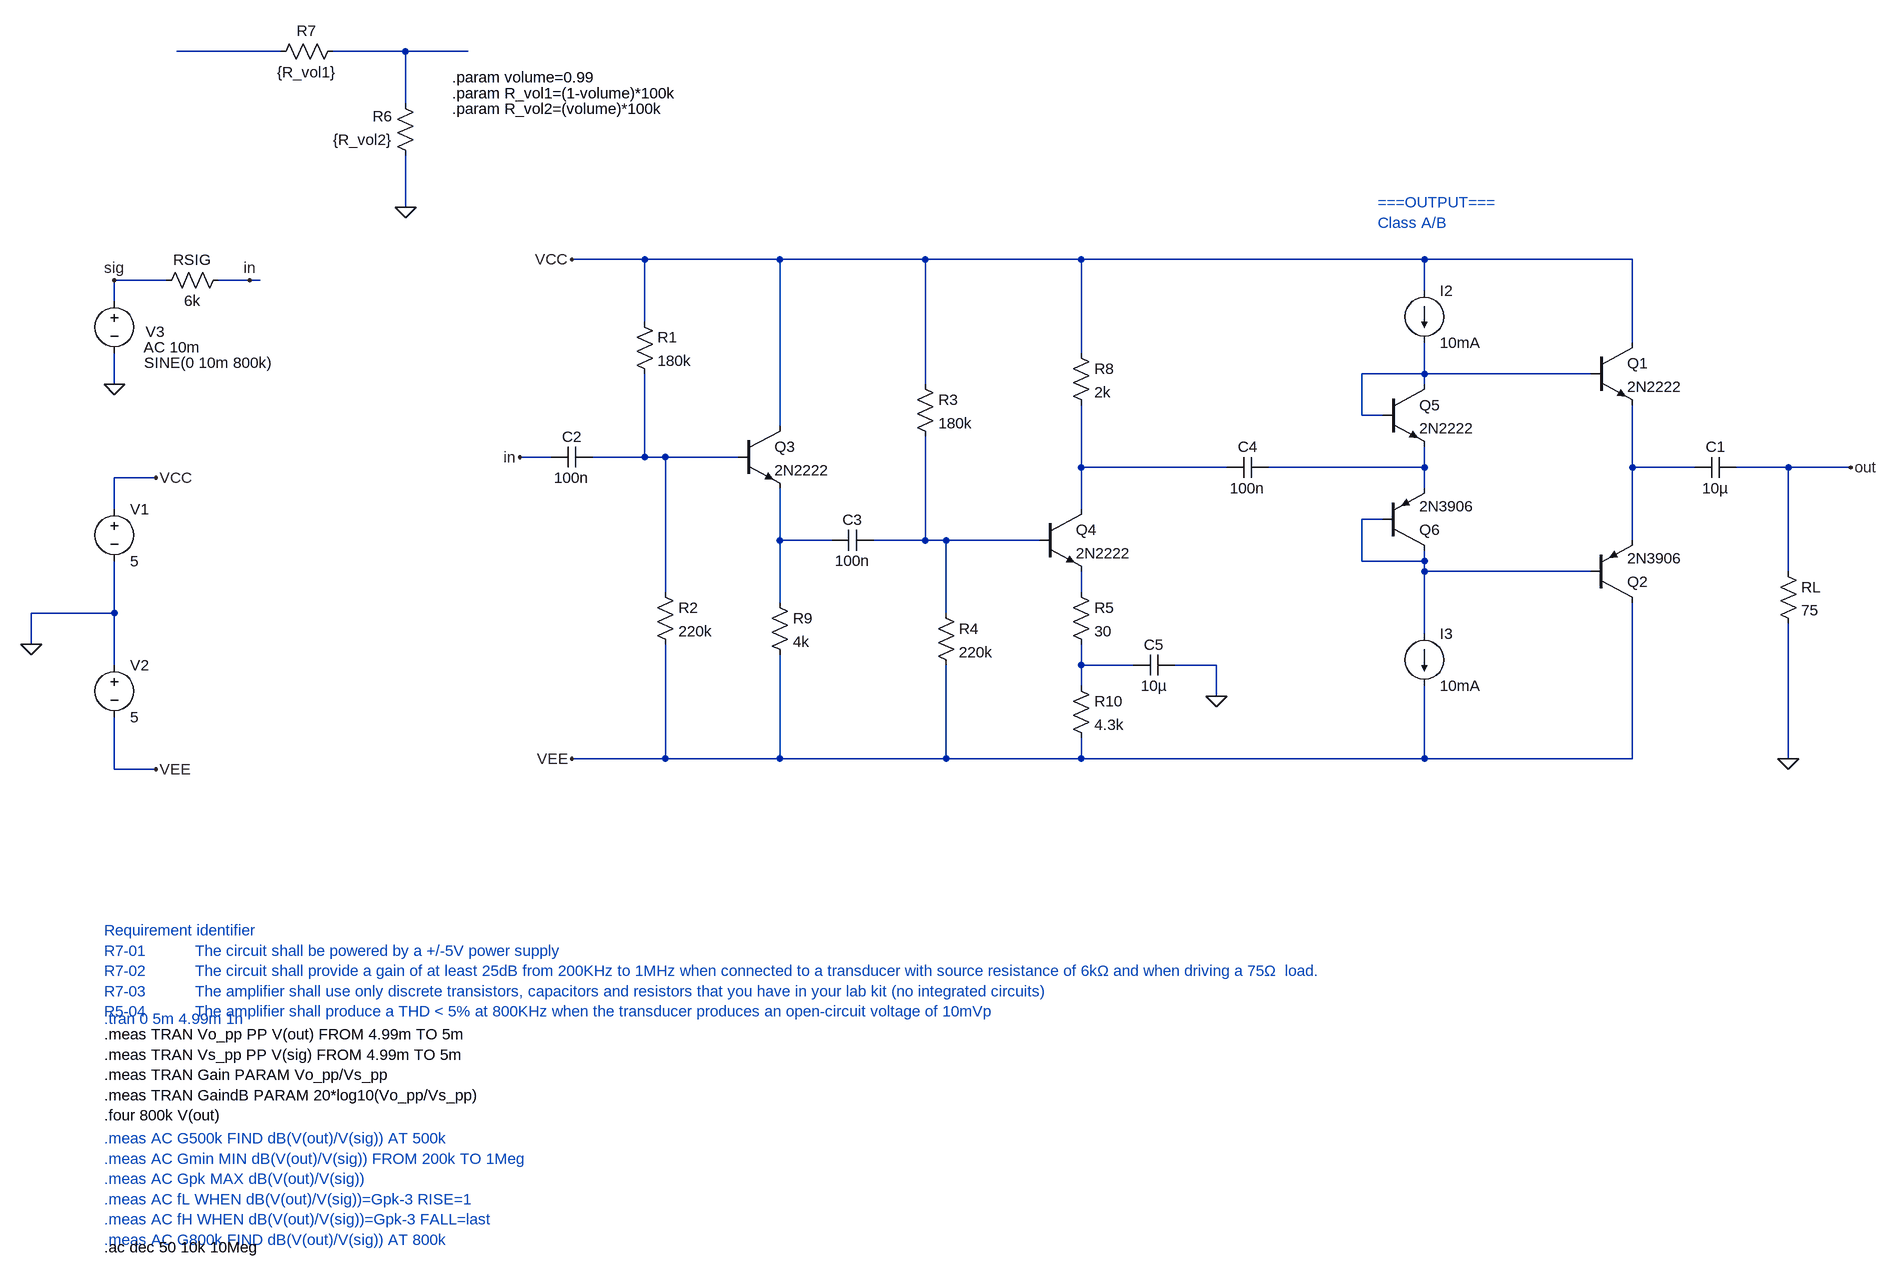
[diagram p0: schematic Lab 7 Amplifer V1.asc]
Lab 7 Amplifer V1.asc, the LTspice schematic file:
Version 4.1
SHEET 1 2900 1024
WIRE 208 -832 48 -832
WIRE 400 -832 288 -832
WIRE 496 -832 400 -832
WIRE 400 -752 400 -832
WIRE 400 -592 400 -672
WIRE 768 -512 656 -512
WIRE 976 -512 768 -512
WIRE 1200 -512 976 -512
WIRE 1440 -512 1200 -512
WIRE 1968 -512 1440 -512
WIRE 2288 -512 1968 -512
WIRE 32 -480 -48 -480
WIRE 160 -480 112 -480
WIRE 176 -480 160 -480
WIRE 1968 -464 1968 -512
WIRE -48 -448 -48 -480
WIRE 768 -416 768 -512
WIRE 2288 -384 2288 -512
WIRE 1440 -368 1440 -512
WIRE 1968 -336 1968 -384
WIRE 1968 -336 1872 -336
WIRE 2224 -336 1968 -336
WIRE -48 -320 -48 -368
WIRE 1200 -320 1200 -512
WIRE 1968 -320 1968 -336
WIRE 1872 -272 1872 -336
WIRE 1904 -272 1872 -272
WIRE 976 -256 976 -512
WIRE 624 -208 576 -208
WIRE 768 -208 768 -336
WIRE 768 -208 688 -208
WIRE 800 -208 768 -208
WIRE 912 -208 800 -208
WIRE 1440 -192 1440 -288
WIRE 1664 -192 1440 -192
WIRE 1968 -192 1968 -224
WIRE 1968 -192 1728 -192
WIRE 2288 -192 2288 -288
WIRE 2384 -192 2288 -192
WIRE 2528 -192 2448 -192
WIRE 2624 -192 2528 -192
WIRE 16 -176 -48 -176
WIRE 1968 -160 1968 -192
WIRE -48 -128 -48 -176
WIRE 1440 -128 1440 -192
WIRE 1904 -112 1872 -112
WIRE 976 -80 976 -160
WIRE 1056 -80 976 -80
WIRE 1200 -80 1200 -240
WIRE 1200 -80 1120 -80
WIRE 1232 -80 1200 -80
WIRE 1376 -80 1232 -80
WIRE 2288 -80 2288 -192
WIRE 1872 -48 1872 -112
WIRE 1968 -48 1968 -64
WIRE 1968 -48 1872 -48
WIRE 1968 -32 1968 -48
WIRE 2224 -32 1968 -32
WIRE 2528 -32 2528 -192
WIRE 800 0 800 -208
WIRE 1440 0 1440 -32
WIRE 976 16 976 -80
WIRE -48 32 -48 -48
WIRE -48 32 -176 32
WIRE 1232 32 1232 -80
WIRE 1968 64 1968 -32
WIRE -176 80 -176 32
WIRE -48 112 -48 32
WIRE 1440 112 1440 80
WIRE 1520 112 1440 112
WIRE 1648 112 1584 112
WIRE 1440 144 1440 112
WIRE 1648 160 1648 112
WIRE 800 256 800 80
WIRE 800 256 656 256
WIRE 976 256 976 96
WIRE 976 256 800 256
WIRE 1232 256 1232 112
WIRE 1232 256 976 256
WIRE 1440 256 1440 224
WIRE 1440 256 1232 256
WIRE 1968 256 1968 144
WIRE 1968 256 1440 256
WIRE 2288 256 2288 16
WIRE 2288 256 1968 256
WIRE 2528 256 2528 48
WIRE -48 272 -48 192
WIRE 16 272 -48 272
FLAG -176 80 0
FLAG 16 272 VEE
FLAG 16 -176 VCC
FLAG -48 -320 0
FLAG -48 -480 sig
FLAG 160 -480 in
FLAG 2528 256 0
FLAG 2624 -192 out
FLAG 400 -592 0
FLAG 656 256 VEE
FLAG 656 -512 VCC
FLAG 576 -208 in
FLAG 1648 160 0
SYMBOL voltage -48 -144 R0
WINDOW 123 0 0 Left 0
WINDOW 39 0 0 Left 0
SYMATTR InstName V1
SYMATTR Value 5
SYMBOL voltage -48 96 R0
WINDOW 123 0 0 Left 0
WINDOW 39 0 0 Left 0
SYMATTR InstName V2
SYMATTR Value 5
SYMBOL voltage -48 -464 R0
WINDOW 0 48 63 Left 2
WINDOW 3 46 111 Left 2
WINDOW 123 45 87 Left 2
WINDOW 39 0 0 Left 0
SYMATTR InstName V3
SYMATTR Value SINE(0 10m 800k)
SYMATTR Value2 AC 10m
SYMBOL res 128 -496 R90
WINDOW 0 0 56 VBottom 2
WINDOW 3 32 56 VTop 2
SYMATTR InstName RSIG
SYMATTR Value 6k
SYMBOL res 2512 -48 R0
SYMATTR InstName RL
SYMATTR Value 75
SYMBOL npn 2224 -384 R0
SYMATTR InstName Q1
SYMATTR Value 2N2222
SYMBOL pnp 2224 16 M180
SYMATTR InstName Q2
SYMATTR Value 2N3906
SYMBOL res 416 -656 R180
WINDOW 0 36 76 Left 2
WINDOW 3 36 40 Left 2
SYMATTR InstName R6
SYMATTR Value {R_vol2}
SYMBOL res 304 -848 R90
WINDOW 0 0 56 VBottom 2
WINDOW 3 32 56 VTop 2
SYMATTR InstName R7
SYMATTR Value {R_vol1}
SYMBOL cap 2448 -208 R90
WINDOW 0 0 32 VBottom 2
WINDOW 3 32 32 VTop 2
SYMATTR InstName C1
SYMATTR Value 10µ
SYMBOL cap 688 -224 R90
WINDOW 0 0 32 VBottom 2
WINDOW 3 32 32 VTop 2
SYMATTR InstName C2
SYMATTR Value 100n
SYMBOL current 1968 -464 R0
WINDOW 123 0 0 Left 0
WINDOW 39 0 0 Left 0
SYMATTR InstName I2
SYMATTR Value 10mA
SYMBOL current 1968 64 R0
WINDOW 123 0 0 Left 0
WINDOW 39 0 0 Left 0
SYMATTR InstName I3
SYMATTR Value 10mA
SYMBOL npn 912 -256 R0
SYMATTR InstName Q3
SYMATTR Value 2N2222
SYMBOL res 752 -432 R0
SYMATTR InstName R1
SYMATTR Value 180k
SYMBOL res 784 -16 R0
SYMATTR InstName R2
SYMATTR Value 220k
SYMBOL npn 1376 -128 R0
SYMATTR InstName Q4
SYMATTR Value 2N2222
SYMBOL cap 1120 -96 R90
WINDOW 0 0 32 VBottom 2
WINDOW 3 32 32 VTop 2
SYMATTR InstName C3
SYMATTR Value 100n
SYMBOL res 1184 -336 R0
SYMATTR InstName R3
SYMATTR Value 180k
SYMBOL res 1216 16 R0
SYMATTR InstName R4
SYMATTR Value 220k
SYMBOL cap 1728 -208 R90
WINDOW 0 0 32 VBottom 2
WINDOW 3 32 32 VTop 2
SYMATTR InstName C4
SYMATTR Value 100n
SYMBOL res 1424 -16 R0
SYMATTR InstName R5
SYMATTR Value 30
SYMBOL res 1424 -384 R0
SYMATTR InstName R8
SYMATTR Value 2k
SYMBOL res 960 0 R0
SYMATTR InstName R9
SYMATTR Value 4k
SYMBOL res 1424 128 R0
SYMATTR InstName R10
SYMATTR Value 4.3k
SYMBOL cap 1584 96 R90
WINDOW 0 0 32 VBottom 2
WINDOW 3 32 32 VTop 2
SYMATTR InstName C5
SYMATTR Value 10µ
SYMBOL npn 1904 -320 R0
SYMATTR InstName Q5
SYMATTR Value 2N2222
SYMBOL pnp 1904 -64 M180
SYMATTR InstName Q6
SYMATTR Value 2N3906
TEXT -64 520 Left 2 ;Requirement identifier\nR7-01           The circuit shall be powered by a +/-5V power supply\nR7-02           The circuit shall provide a gain of at least 25dB from 200KHz to 1MHz when connected to a transducer with source resistance of 6kΩ and when driving a 75Ω  load.\nR7-03           The amplifier shall use only discrete transistors, capacitors and resistors that you have in your lab kit (no integrated circuits)\nR5-04           The amplifier shall produce a THD < 5% at 800KHz when the transducer produces an open-circuit voltage of 10mVp
TEXT -64 656 Left 2 ;.tran 0 5m 4.99m 1n
TEXT 1896 -600 Left 2 ;===OUTPUT===\nClass A/B
TEXT 472 -792 Left 2 !.param volume=0.99
TEXT 472 -768 Left 2 !.param R_vol1=(1-volume)*100k
TEXT 472 -744 Left 2 !.param R_vol2=(volume)*100k
TEXT -64 680 Left 2 !.meas TRAN Vo_pp PP V(out) FROM 4.99m TO 5m\n.meas TRAN Vs_pp PP V(sig) FROM 4.99m TO 5m\n.meas TRAN Gain PARAM Vo_pp/Vs_pp\n.meas TRAN GaindB PARAM 20*log10(Vo_pp/Vs_pp)\n.four 800k V(out)
TEXT -64 840 Left 2 ;.meas AC G500k FIND dB(V(out)/V(sig)) AT 500k\n.meas AC Gmin MIN dB(V(out)/V(sig)) FROM 200k TO 1Meg\n.meas AC Gpk MAX dB(V(out)/V(sig))\n.meas AC fL WHEN dB(V(out)/V(sig))=Gpk-3 RISE=1\n.meas AC fH WHEN dB(V(out)/V(sig))=Gpk-3 FALL=last\n.meas AC G800k FIND dB(V(out)/V(sig)) AT 800k
TEXT -64 1008 Left 2 !.ac dec 50 10k 10Meg

The netlist it stands for:
* Lab 7 Amplifer V1.asc
V1 VCC 0 5
V2 0 VEE 5
V3 sig 0 SINE(0 10m 800k) AC 10m
RSIG in sig 6k
RL out 0 75
Q1 VCC N003 N007 0 2N2222
Q2 VEE N008 N007 0 2N3906
R6 0 N002 {R_vol2}
R7 N002 N001 {R_vol1}
C1 out N007 10µ
C2 N004 in 100n
I2 VCC N003 10mA
I3 N008 VEE 10mA
Q3 VCC N004 N009 0 2N2222
R1 VCC N004 180k
R2 N004 VEE 220k
Q4 N005 N010 N011 0 2N2222
C3 N010 N009 100n
R3 VCC N010 180k
R4 N010 VEE 220k
C4 N006 N005 100n
R5 N011 N012 30
R8 VCC N005 2k
R9 N009 VEE 4k
R10 N012 VEE 4.3k
C5 0 N012 10µ
Q5 N003 N003 N006 0 2N2222
Q6 N008 N008 N006 0 2N3906
.model NPN NPN
.model PNP PNP
.lib standard.bjt
* Requirement identifier
* R7-01           The circuit shall be powered by a +/-5V power supply
* R7-02           The circuit shall provide a gain of at least 25dB from 200KHz to 1MHz when connected to a transducer with source resistance of 6kΩ and when driving a 75Ω  load.
* R7-03           The amplifier shall use only discrete transistors, capacitors and resistors that you have in your lab kit (no integrated circuits)
* R5-04           The amplifier shall produce a THD < 5% at 800KHz when the transducer produces an open-circuit voltage of 10mVp
* .tran 0 5m 4.99m 1n
* ===OUTPUT===
* Class A/B
.param volume=0.99
.param R_vol1=(1-volume)*100k
.param R_vol2=(volume)*100k
.meas TRAN Vo_pp PP V(out) FROM 4.99m TO 5m
.meas TRAN Vs_pp PP V(sig) FROM 4.99m TO 5m
.meas TRAN Gain PARAM Vo_pp/Vs_pp
.meas TRAN GaindB PARAM 20*log10(Vo_pp/Vs_pp)
.four 800k V(out)
* .meas AC G500k FIND dB(V(out)/V(sig)) AT 500k
* .meas AC Gmin MIN dB(V(out)/V(sig)) FROM 200k TO 1Meg
* .meas AC Gpk MAX dB(V(out)/V(sig))
* .meas AC fL WHEN dB(V(out)/V(sig))=Gpk-3 RISE=1
* .meas AC fH WHEN dB(V(out)/V(sig))=Gpk-3 FALL=last
* .meas AC G800k FIND dB(V(out)/V(sig)) AT 800k
.ac dec 50 10k 10Meg
.backanno
.end